# Altium schematic sheet Top_sheet.SchDoc
size A; DocumentNumber: 1; SheetNumber: 1; SheetTotal: 4
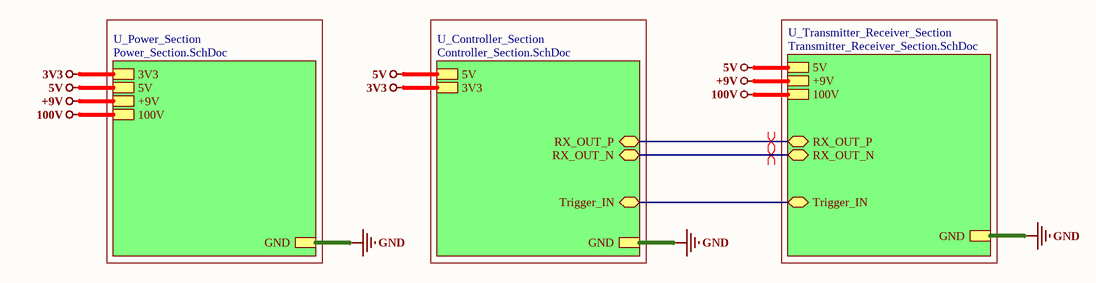
[diagram p0: Top_sheet.SchDoc]

## Sub-sheets
U_Controller_Section = Controller_Section.SchDoc: RX_OUT_P (bidir), RX_OUT_N (bidir), 3V3, GND, 5V, Trigger_IN (bidir)
U_Power_Section = Power_Section.SchDoc: 3V3, GND, +9V, 5V, 100V
U_Transmitter_Receiver_Section = Transmitter_Receiver_Section.SchDoc: RX_OUT_P (bidir), RX_OUT_N (bidir), Trigger_IN (bidir), GND, +9V, 5V, 100V

## Nets
3V3: sheet U_Controller_Section/3V3, sheet U_Power_Section/3V3
5V: sheet U_Transmitter_Receiver_Section/5V, sheet U_Controller_Section/5V, sheet U_Power_Section/5V
100V: sheet U_Transmitter_Receiver_Section/100V, sheet U_Power_Section/100V
+9V: sheet U_Transmitter_Receiver_Section/+9V, sheet U_Power_Section/+9V
GND: sheet U_Transmitter_Receiver_Section/GND, sheet U_Controller_Section/GND, sheet U_Power_Section/GND
(unnamed): sheet U_Transmitter_Receiver_Section/RX_OUT_P, sheet U_Controller_Section/RX_OUT_P
(unnamed): sheet U_Transmitter_Receiver_Section/RX_OUT_N, sheet U_Controller_Section/RX_OUT_N
(unnamed): sheet U_Transmitter_Receiver_Section/Trigger_IN, sheet U_Controller_Section/Trigger_IN

## Layout directives
differential pair; differential pair class RX_OUT_Lines; net class RX_OUT; rule Matched Net Lengths [Tolerance = 50mil]; rule Impedance Constraint [Min = 85.00    Max = 90.00    ]: (no net found under the mark)